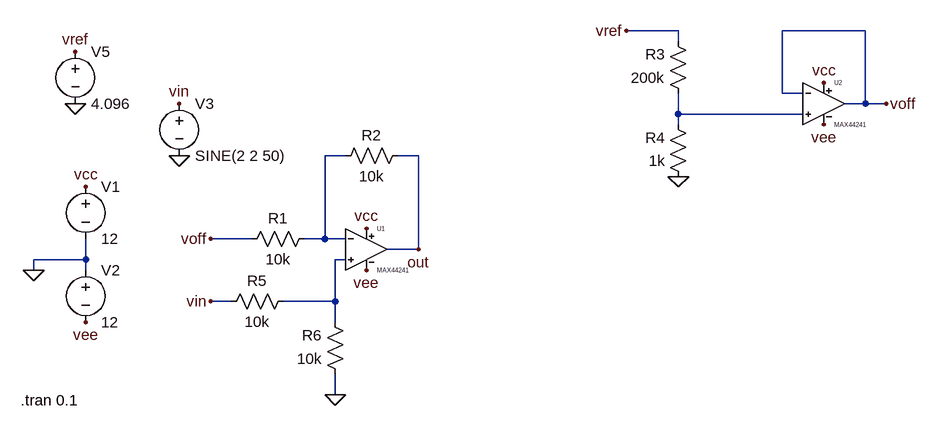
[diagram p0: schematic opamp_differential.asc]
opamp_differential.asc, the LTspice schematic file:
Version 4
SHEET 1 1060 680
WIRE 672 -192 592 -192
WIRE 960 -192 832 -192
WIRE 672 -176 672 -192
WIRE 832 -96 832 -192
WIRE 864 -96 832 -96
WIRE 960 -80 960 -192
WIRE 960 -80 928 -80
WIRE 992 -80 960 -80
WIRE 672 -64 672 -96
WIRE 864 -64 672 -64
WIRE 672 -48 672 -64
WIRE 160 0 128 0
WIRE 272 0 240 0
WIRE 16 128 -48 128
WIRE 128 128 128 0
WIRE 128 128 96 128
WIRE 160 128 128 128
WIRE 272 144 272 0
WIRE 272 144 224 144
WIRE -240 160 -240 128
WIRE -240 160 -320 160
WIRE 160 160 144 160
WIRE -320 176 -320 160
WIRE -240 176 -240 160
WIRE -16 224 -48 224
WIRE 144 224 144 160
WIRE 144 224 64 224
WIRE 144 256 144 224
WIRE 144 368 144 336
FLAG -320 176 0
FLAG -240 48 vcc
FLAG 192 112 vcc
FLAG -240 256 vee
FLAG 192 176 vee
FLAG -96 0 0
FLAG -96 -80 vin
FLAG 272 144 out
FLAG -256 -80 0
FLAG -256 -160 vref
FLAG -48 224 vin
FLAG 896 -112 vcc
FLAG 896 -48 vee
FLAG 672 32 0
FLAG 592 -192 vref
FLAG 992 -80 voff
FLAG 144 368 0
FLAG -48 128 voff
SYMBOL my\\MAX44241 192 80 R0
SYMATTR InstName U1
SYMBOL voltage -240 32 R0
WINDOW 123 0 0 Left 2
WINDOW 39 0 0 Left 2
SYMATTR InstName V1
SYMATTR Value 12
SYMBOL voltage -240 160 R0
WINDOW 123 0 0 Left 2
WINDOW 39 0 0 Left 2
SYMATTR InstName V2
SYMATTR Value 12
SYMBOL voltage -96 -96 R0
WINDOW 123 0 0 Left 2
WINDOW 39 0 0 Left 2
SYMATTR InstName V3
SYMATTR Value SINE(2 2 50)
SYMBOL res 112 112 R90
WINDOW 0 0 56 VBottom 2
WINDOW 3 32 56 VTop 2
SYMATTR InstName R1
SYMATTR Value 10k
SYMBOL res 256 -16 R90
WINDOW 0 0 56 VBottom 2
WINDOW 3 32 56 VTop 2
SYMATTR InstName R2
SYMATTR Value 10k
SYMBOL voltage -256 -176 R0
WINDOW 123 0 0 Left 2
WINDOW 39 0 0 Left 2
SYMATTR InstName V5
SYMATTR Value 4.096
SYMBOL my\\MAX44241 896 -144 R0
SYMATTR InstName U2
SYMBOL res 688 -80 R180
WINDOW 0 36 76 Left 2
WINDOW 3 36 40 Left 2
SYMATTR InstName R3
SYMATTR Value 200k
SYMBOL res 688 48 R180
WINDOW 0 36 76 Left 2
WINDOW 3 36 40 Left 2
SYMATTR InstName R4
SYMATTR Value 1k
SYMBOL res 80 208 R90
WINDOW 0 0 56 VBottom 2
WINDOW 3 32 56 VTop 2
SYMATTR InstName R5
SYMATTR Value 10k
SYMBOL res 160 352 R180
WINDOW 0 36 76 Left 2
WINDOW 3 36 40 Left 2
SYMATTR InstName R6
SYMATTR Value 10k
TEXT -340 376 Left 2 !.tran 0.1

The netlist it stands for:
* opamp_differential.asc
XU1 N003 N002 vcc vee out MAX44241  ; pins INA+ INA- VDD VSS OUTA
V1 vcc 0 12
V2 0 vee 12
V3 vin 0 SINE(2 2 50)
R1 N002 voff 10k
R2 out N002 10k
V5 vref 0 4.096
XU2 N001 voff vcc vee voff MAX44241  ; pins INA+ INA- VDD VSS OUTA
R3 N001 vref 200k
R4 0 N001 1k
R5 N003 vin 10k
R6 0 N003 10k
.tran 0.1
.lib MAX44241.lib
.backanno
.end